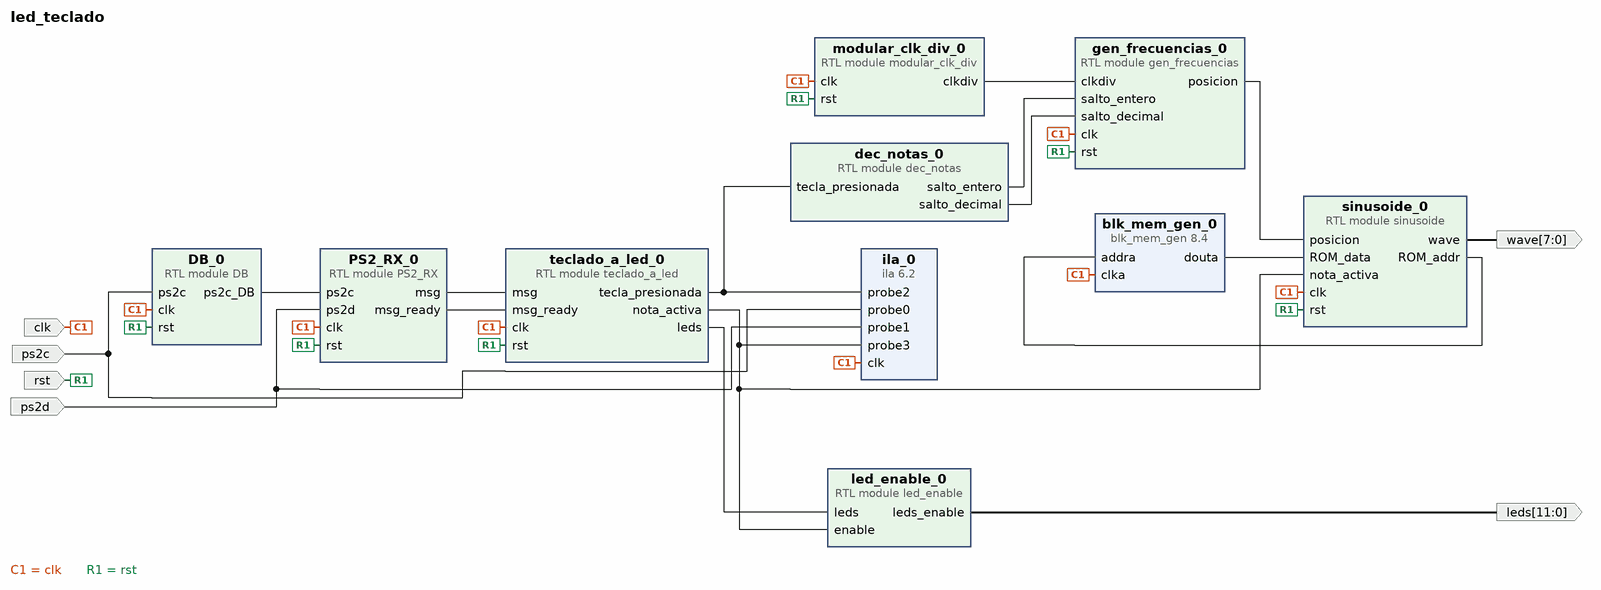
[diagram p0: block diagram of the top level]
# Vivado block design led_teclado, xc7a35tcpg236-1, Vivado 2020.1
create_bd_design led_teclado

create_bd_port -dir I -type clk clk
create_bd_port -dir I ps2c
create_bd_port -dir I -type rst rst
create_bd_port -dir I ps2d
create_bd_port -dir O -from 11 -to 0 leds
create_bd_port -dir O -from 7 -to 0 wave

create_bd_cell -type ip -vlnv xilinx.com:ip:ila:6.2 ila_0
set_property -dict [list \
  CONFIG.C_DATA_DEPTH 16384 \
  CONFIG.C_ENABLE_ILA_AXI_MON false \
  CONFIG.C_MONITOR_TYPE Native \
  CONFIG.C_NUM_OF_PROBES 4 \
  CONFIG.C_PROBE2_WIDTH 8 \
] [get_bd_cells ila_0]
create_bd_cell -type module -reference PS2_RX PS2_RX_0
create_bd_cell -type module -reference DB DB_0
create_bd_cell -type module -reference led_enable led_enable_0
create_bd_cell -type module -reference gen_frecuencias gen_frecuencias_0
create_bd_cell -type module -reference modular_clk_div modular_clk_div_0
set_property -dict {CONFIG.N 12500} [get_bd_cells modular_clk_div_0]
create_bd_cell -type module -reference sinusoide sinusoide_0
create_bd_cell -type ip -vlnv xilinx.com:ip:blk_mem_gen:8.4 blk_mem_gen_0
set_property -dict [list \
  CONFIG.Coe_File ../../../../../../coe/cuarto_sen.coe \
  CONFIG.Enable_32bit_Address false \
  CONFIG.Enable_A Always_Enabled \
  CONFIG.Load_Init_File true \
  CONFIG.Memory_Type Single_Port_ROM \
  CONFIG.Port_A_Write_Rate 0 \
  CONFIG.Register_PortA_Output_of_Memory_Primitives true \
  CONFIG.Use_RSTA_Pin false \
  CONFIG.Write_Depth_A 128 \
  CONFIG.Write_Width_A 8 \
  CONFIG.use_bram_block Stand_Alone \
] [get_bd_cells blk_mem_gen_0]
create_bd_cell -type module -reference teclado_a_led teclado_a_led_0
create_bd_cell -type module -reference dec_notas dec_notas_0

# ---- connections ----

connect_bd_net -net clk_0_1 [get_bd_ports clk] \
  [get_bd_pins ila_0/clk] [get_bd_pins PS2_RX_0/clk] [get_bd_pins DB_0/clk] [get_bd_pins gen_frecuencias_0/clk] \
  [get_bd_pins modular_clk_div_0/clk] [get_bd_pins sinusoide_0/clk] [get_bd_pins blk_mem_gen_0/clka] \
  [get_bd_pins teclado_a_led_0/clk]
connect_bd_net -net ps2c_0_1 [get_bd_ports ps2c] [get_bd_pins ila_0/probe0] [get_bd_pins DB_0/ps2c]
connect_bd_net -net rst_0_1 [get_bd_ports rst] \
  [get_bd_pins PS2_RX_0/rst] [get_bd_pins DB_0/rst] [get_bd_pins gen_frecuencias_0/rst] [get_bd_pins modular_clk_div_0/rst] \
  [get_bd_pins sinusoide_0/rst] [get_bd_pins teclado_a_led_0/rst]
connect_bd_net -net ps2d_0_1 [get_bd_ports ps2d] [get_bd_pins ila_0/probe1] [get_bd_pins PS2_RX_0/ps2d]
connect_bd_net [get_bd_pins PS2_RX_0/msg] [get_bd_pins teclado_a_led_0/msg]
connect_bd_net [get_bd_pins PS2_RX_0/msg_ready] [get_bd_pins teclado_a_led_0/msg_ready]
connect_bd_net [get_bd_pins teclado_a_led_0/leds] [get_bd_pins led_enable_0/leds]
connect_bd_net [get_bd_pins teclado_a_led_0/nota_activa] \
  [get_bd_pins ila_0/probe3] [get_bd_pins led_enable_0/enable] [get_bd_pins sinusoide_0/nota_activa]
connect_bd_net [get_bd_pins led_enable_0/leds_enable] [get_bd_ports leds]
connect_bd_net [get_bd_pins teclado_a_led_0/tecla_presionada] [get_bd_pins ila_0/probe2] [get_bd_pins dec_notas_0/tecla_presionada]
connect_bd_net [get_bd_pins DB_0/ps2c_DB] [get_bd_pins PS2_RX_0/ps2c]
connect_bd_net [get_bd_pins dec_notas_0/salto_entero] [get_bd_pins gen_frecuencias_0/salto_entero]
connect_bd_net [get_bd_pins dec_notas_0/salto_decimal] [get_bd_pins gen_frecuencias_0/salto_decimal]
connect_bd_net [get_bd_pins modular_clk_div_0/clkdiv] [get_bd_pins gen_frecuencias_0/clkdiv]
connect_bd_net [get_bd_pins gen_frecuencias_0/posicion] [get_bd_pins sinusoide_0/posicion]
connect_bd_net [get_bd_pins blk_mem_gen_0/douta] [get_bd_pins sinusoide_0/ROM_data]
connect_bd_net [get_bd_pins sinusoide_0/ROM_addr] [get_bd_pins blk_mem_gen_0/addra]
connect_bd_net [get_bd_pins sinusoide_0/wave] [get_bd_ports wave]

validate_bd_design
save_bd_design
